# EAGLE design v1 (EAGLE 9.6.2)
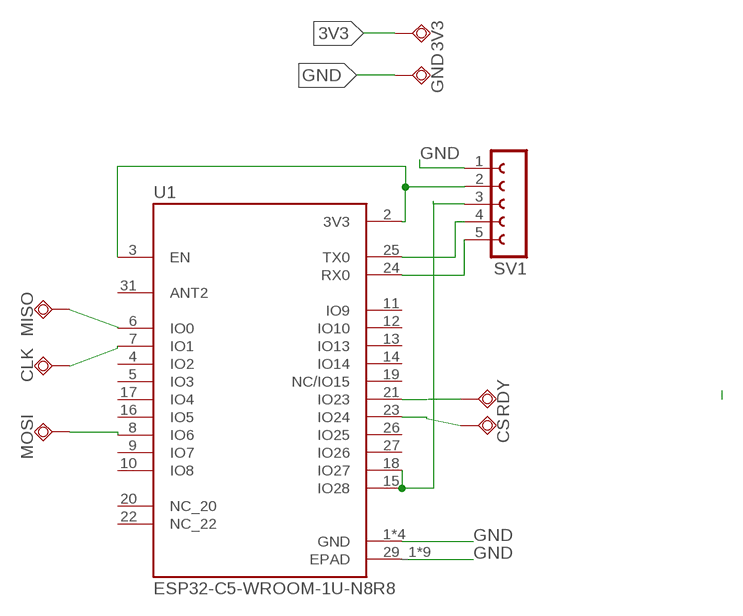
[diagram p0: schematic, sheet 1]

## Parts
3V3  TPSQTP09SQ  [TP09SQ]
CLK  TPSQTP09SQ  [TP09SQ]
CS  TPSQTP09SQ  [TP09SQ]
GND  TPSQTP09SQ  [TP09SQ]
MISO  TPSQTP09SQ  [TP09SQ]
MOSI  TPSQTP09SQ  [TP09SQ]
RDY  TPSQTP09SQ  [TP09SQ]
SV1  FE05-1  [FE05-1]
U1  ESP32-C5-WROOM-1U-N8R8  [XCVR_ESP32-C5-WROOM-1U-N8R8]

## Nets
3V3: 3V3.TP SV1.2 U1.2(3V3) U1.3(EN)
GND: GND.TP SV1.1 U1.1(GND) U1.28(GND) U1.29_1(EPAD) U1.29_2(EPAD) U1.29_3(EPAD) U1.29_4(EPAD) U1.29_5(EPAD) U1.29_6(EPAD) U1.29_7(EPAD) U1.29_8(EPAD) U1.29_9(EPAD) U1.30(GND) U1.32(GND)
N$2: RDY.TP U1.21(IO23)
N$3: CS.TP U1.23(IO24)
N$4: MISO.TP U1.6(IO0)
N$5: CLK.TP U1.7(IO1)
N$6: SV1.3 U1.15(IO28) U1.18(IO27)
N$7: MOSI.TP U1.8(IO6)
N$8: SV1.5 U1.24(RX0)
N$9: SV1.4 U1.25(TX0)
Unconnected: U1.4(IO2) U1.5(IO3) U1.9(IO7) U1.10(IO8) U1.11(IO9) U1.12(IO10) U1.13(IO13) U1.14(IO14) U1.16(IO5) U1.17(IO4) U1.19(NC/IO15) U1.20(NC_20) U1.22(NC_22) U1.26(IO25) U1.27(IO26) U1.31(ANT2)

## Library data of the parts
3V3 CLK CS GND MISO MOSI RDY = testpad:TPSQ: Test pad
SV1 = con-lsta:FE05-1: FEMALE HEADER; OC_FARNELL: unknown; OC_NEWARK: unknown
U1 = ESP32-C5-WROOM-1U-N8R8:ESP32-C5-WROOM-1U-N8R8: Check availability <https://pricing.snapeda.com/parts/ESP32-C5-WROOM-1U-N8R8/Espressif%20Systems/view-part?ref=eda>; AVAILABILITY: In Stock; CHECK_PRICES: https://www.snapeda.com/parts/ESP32-C5-WROOM-1U-N8R8/Espressif+Systems/view-part/?ref=eda; DESCRIPTION: 802.15.4, Bluetooth, WiFi 802.11b/g/n/ac/ax, Bluetooth v5.0, Thread, Zigbee® Transceiver Module 2.412GHz ~ 2.484GHz, 5.18GHz ~ 5.885GHz Antenna Not Included Surface Mount; MF: Espressif Systems; MP: ESP32-C5-WROOM-1U-N8R8; PACKAGE: None; PRICE: None; PURCHASE-URL: https://www.snapeda.com/api/url_track_click_mouser/?unipart_id=18942872&manufacturer=Espressif Systems&part_name=ESP32-C5-WROOM-1U-N8R8&search_term=None; SNAPEDA_LINK: https://www.snapeda.com/parts/ESP32-C5-WROOM-1U-N8R8/Espressif+Systems/view-part/?ref=snap

## Board
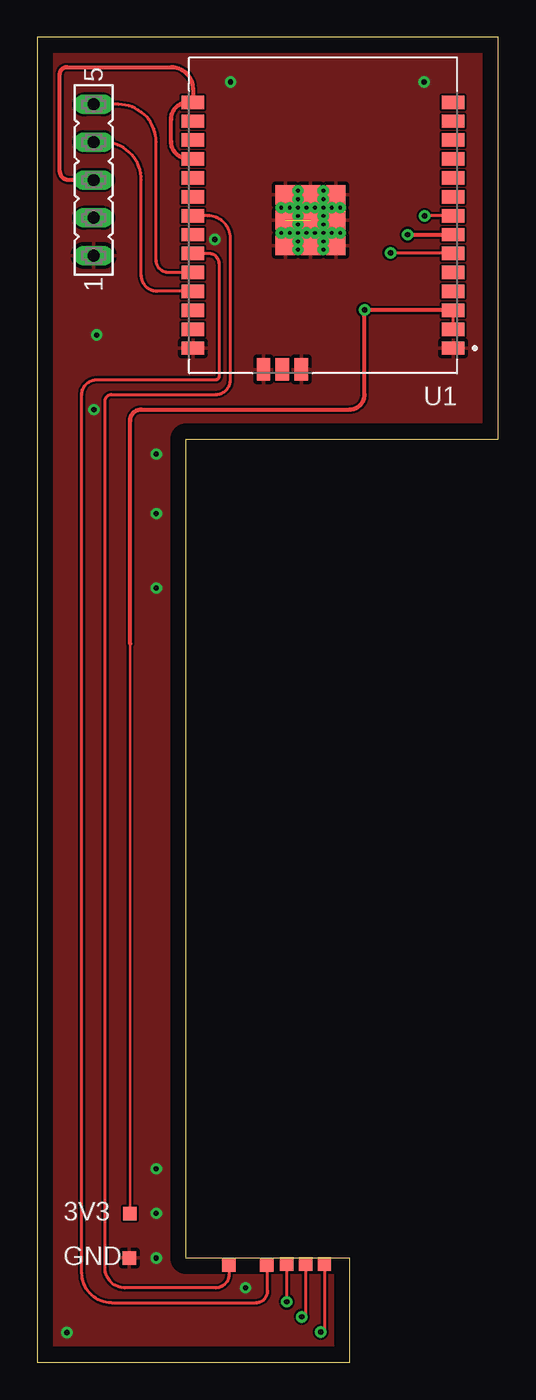
[diagram p1: board, top side]
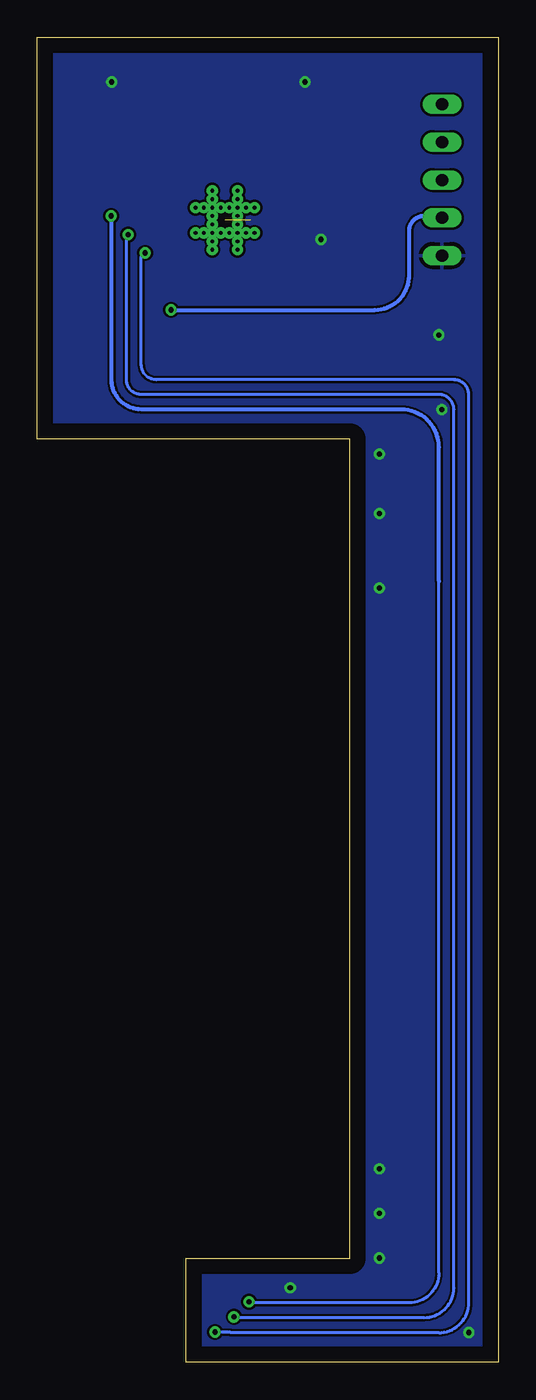
[diagram p2: board, bottom side, seen from below]

Size 31 x 89 mm. Coordinates in mm from the lower left corner, seen from the top.
Outline: 0,0 21,0 21,7 10,7 10,62 31,62 31,89 0,89 0,0
Copper layers (1*16): Top 0.035mm / dielectric 1.5mm / Bottom 0.035mm
Design rules "default": minimum track width 6mil, minimum drill 0.35mm, track to track 6mil, track to pad 6mil, pad to pad 6mil, via to via 6mil, smd to smd 6mil, copper to edge 40mil, drill to drill 6mil, minimum pad ring 10mil, minimum via ring 8mil, stop-mask expansion 4mil, vias tented up to drill 0mil, thermal gap 10mil

### Footprints (pad centres in the part's own frame; a part is rotated, then mirrored left to right if it is on the bottom)
TP09SQ = smd 0.9 x 0.9: TP 0,0
FE05-1 = drill 0.813 long: 1 -5.08,0; 2 -2.54,0; 3 0,0; 4 2.54,0; 5 5.08,0
XCVR_ESP32-C5-WROOM-1U-N8R8 = smd 1.5 x 0.9: 1 -8.75,8.91; 2 -8.75,7.64; 3 -8.75,6.37; 4 -8.75,5.1; 5 -8.75,3.83; 6 -8.75,2.56; 7 -8.75,1.29; 8 -8.75,0.02; 9 -8.75,-1.25; 10 -8.75,-2.52; 11 -8.75,-3.79; 12 -8.75,-5.06; 13 -8.75,-6.33; 14 -8.75,-7.6; 15 8.75,-7.6; 16 8.75,-6.33; 17 8.75,-5.06; 18 8.75,-3.79; 19 8.75,-2.52; 20 8.75,-1.25; 21 8.75,0.02; 22 8.75,1.29; 23 8.75,2.56; 24 8.75,3.83; 25 8.75,5.1; 26 8.75,6.37; 27 8.75,7.64; 28 8.75,8.91 | smd 1.3 x 1.3: 29_1 -0.87,2.022; 29_2 0.83,2.022; 29_3 2.53,2.022; 29_4 -0.87,0.322; 29_5 0.83,0.322; 29_6 2.53,0.322; 29_7 -0.87,-1.378; 29_8 0.83,-1.378; 29_9 2.53,-1.378 | drill 0.25 pad 0.35: 29_10 -0.02,2.304; 29_11 -0.02,1.738; 29_12 1.68,2.304; 29_13 1.68,1.738; 29_14 -1.152,1.172; 29_15 -0.586,1.172; 29_16 -0.02,1.172; 29_17 0.547,1.172; 29_18 1.113,1.172; 29_19 1.68,1.172; 29_20 2.246,1.172; 29_21 2.812,1.172; 29_22 -0.02,0.605; 29_23 -0.02,0.039; 29_24 1.68,0.605; 29_25 1.68,0.039; 29_26 -1.152,-0.528; 29_27 -0.586,-0.528; 29_28 -0.02,-0.528; 29_29 0.547,-0.528; 29_30 1.113,-0.528; 29_31 1.68,-0.528; 29_32 2.246,-0.528; 29_33 2.812,-0.528; 29_34 -0.02,-1.094; 29_35 -0.02,-1.66; 29_36 1.68,-1.094; 29_37 1.68,-1.66 | smd 0.9 x 1.5: 30 4,10.35; 31 2.73,10.35; 32 1.46,10.35

### Placement (x,y rotation side)
3V3  6.22,10 0 top
CLK  18.03,6.59 0 top
CS  15.42,6.54 0 top
GND  6.19,7 0 top
MISO  19.3,6.59 0 top
MOSI  16.76,6.59 0 top
RDY  12.89,6.54 0 top
SV1  3.79,79.41 90 top
U1  19.21,77.03 180 top

### Tracks (layer width: path | path; a pad name or v marks a point on that pad's centre or on a via)
3V3  (via drill 0.35)
  Top 0.152: 6.25,48.24 6.25,10.14 3V3.TP
  Top 0.2: U1.2 U1.3
  Top 0.254: U1.3 22.02,70.66 v22,70.68 22,65 arc-90 21,64 7,64 arc90 6.25,63.25 6.25,48.24
  Bottom 0.254: v22,70.68 8.32,70.68 arc-90 6,73 6,76 arc90 5,77 3.92,77 arc90 SV1.2
GND  (via drill 0.35)  (1 unrouted)
  other vias: 11.94,75.42 3.81,63.99 8,7 8,10 8,13 2,2 14,5 8,52 8,57 8,61 26,86 13,86 4,69
  pour Top: 0,0 0,89 31,89 31,50 10,50 10,7 21,7 21,0
  pour Bottom: 0,0 21,0 21,7 10,7 10,50 31,50 31,89 0,89
N$2
  Top 0.2: RDY.TP 12.89,5.89 arc-90 12,5 5.89,5 arc-90 4.56,6.33 4.56,64.56 arc-90 5,65 12,65 arc90 12.98,65.98 12.98,75.49 arc90 11.46,77.01 U1.21
N$3
  Top 0.2: 10.46,74.39 U1.23 11.53,74.47 arc-90 12.24,73.76 12.24,66.24 arc-90 12,66 4.02,66 arc90 3,64.98 3,6 arc90 5,4 14.68,4 arc90 15.49,4.81 15.49,6.47 arc90 CS.TP
N$4  (via drill 0.35)
  Top 0.2: U1.6 27.92,74.51 v23.75,74.51 | MISO.TP 19.3,2.29 arc-90 v19.05,2.03
  Bottom 0.2: v19.05,2.03 18.05,2.03 arc90 18,1.98 4.02,1.98 arc-90 2,4 2,65 arc-90 3,66 23,66 arc90 24,67 24,74.25 arc90 v23.75,74.51
N$5  (via drill 0.35)
  Top 0.2: v24.89,75.74 arc90 v24.89,75.74 | CLK.TP 18.03,3.3 arc-90 v17.78,3.05
  Top 0.254: v24.89,75.74 U1.7 arc90 U1.7
  Bottom 0.2: v17.78,3.05 arc-90 17.73,3 5,3 arc-90 3,5 3,64 arc-90 4,65 24,65 arc90 25,66 25,75.63 arc90 v24.89,75.74
N$6
  Top 0.254: SV1.3 2.11,79.41 arc-90 1.52,79.99 1.52,86.52 arc-90 2,87 9,87 arc-90 10.46,85.54 U1.15 10.14,84.63 arc90 9,83.49 9,82 arc90 10.18,80.82 U1.18
N$7  (via drill 0.35)
  Top 0.2: U1.8 26.04,77.01 arc90 v26.03,77 | MOSI.TP v16.76,4.06
  Bottom 0.2: 4,52.46 4,6 arc90 6,4 16.7,4 arc90 v16.76,4.06
  Bottom 0.254: 4,52.46 4,61.46 arc-90 6.54,64 24,64 arc90 26,66 26,76.97 arc-90 v26.03,77
N$8
  Top 0.2: U1.24 8.8,73.2 arc-90 8,74 8,81.95 arc90 5.46,84.49 SV1.5
N$9
  Top 0.2: U1.25 8.07,71.93 arc-90 7,73 7,79.41 arc90 4.46,81.95 SV1.4